# Altium schematic sheet Drive_Motor_Section.SchDoc
size A4; Organization: Altium Limited; Address1: L3, 12a Rodborough Rd; Address2: Frenchs Forest; Address3: NSW; Address4: Australia 2086; DocumentNumber: 3; SheetNumber: 3; SheetTotal: 8
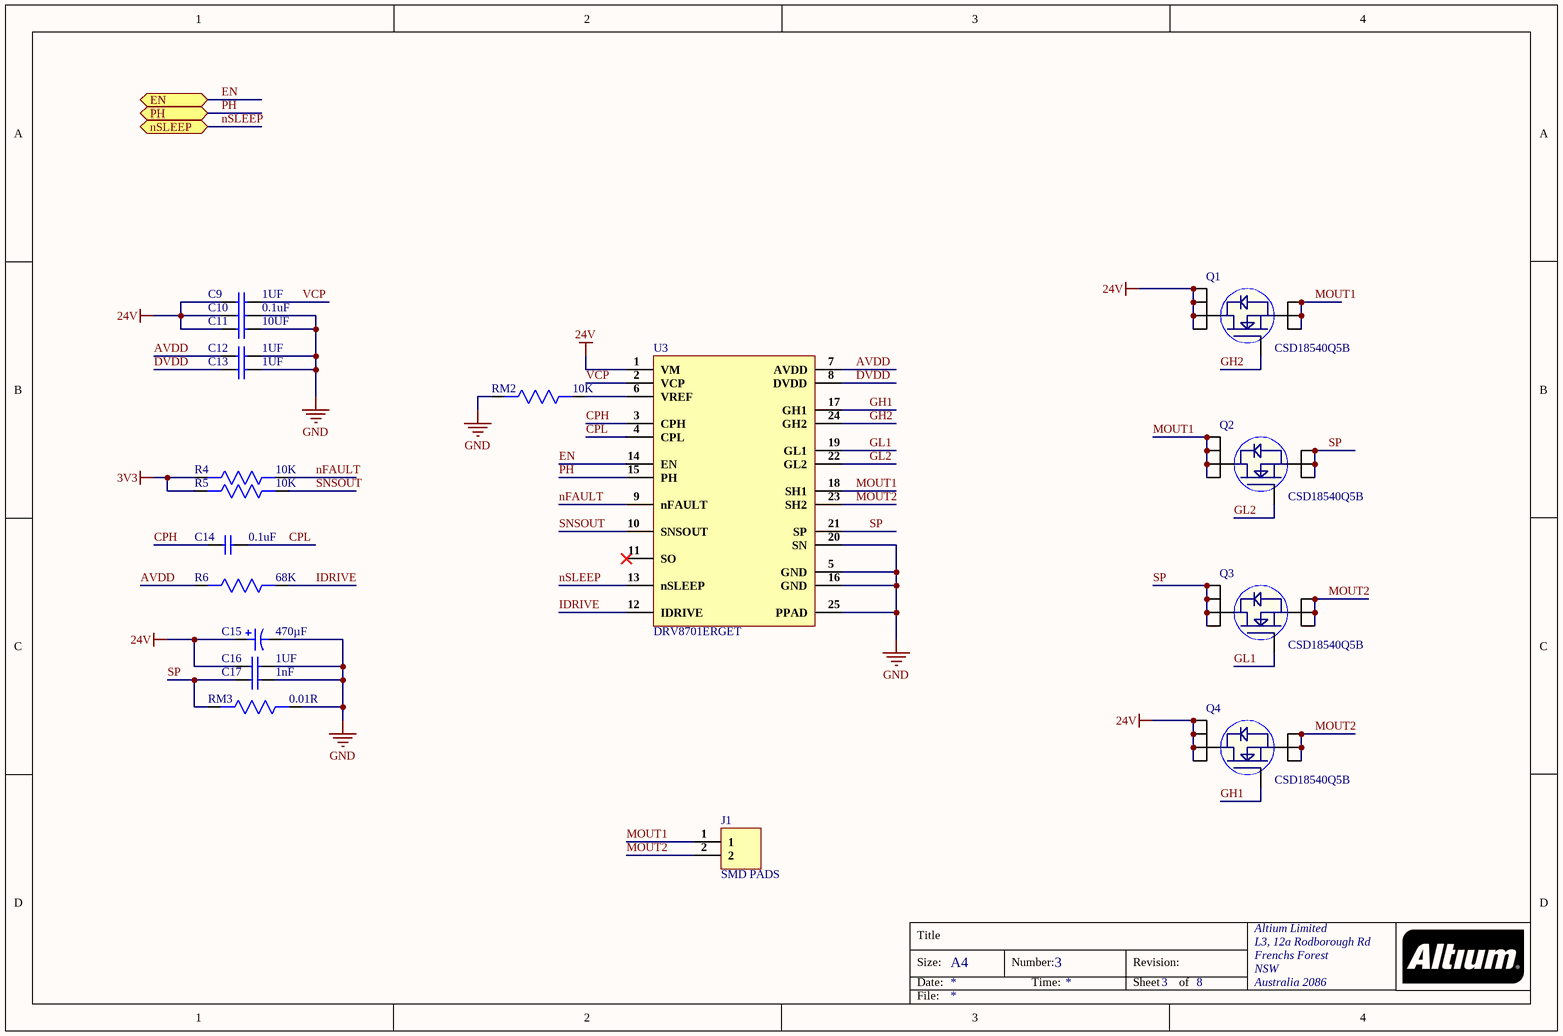
[diagram p0: Drive_Motor_Section.SchDoc]

## Parts
C9  1UF  [Cap0805]
C10  0.1uF  [CAP 0402]
C11  10UF  [Cap1206]
C12  1UF  [Cap0805]
C13  1UF  [Cap0805]
C14  0.1uF  [CAP 0402]
C15  470µF  [UCD1V471MNL6GS]
C16  1UF  [Cap0805]
C17  1nF  [CAP 0201]
J1  SMD PADS  [SMD PAD]
Q1  CSD18540Q5B  [8-VSON-CLIP]
Q2  CSD18540Q5B  [8-VSON-CLIP]
Q3  CSD18540Q5B  [8-VSON-CLIP]
Q4  CSD18540Q5B  [8-VSON-CLIP]
R4  10K  [Res-0201]
R5  10K  [Res-0201]
R6  68K  [Res0603]
RM2  10K  [Res-0201]
RM3  0.01R  [Res0603]
U3  DRV8701ERGET  [DRV8701ERGET]

## Ports
EN (bidir), nSLEEP (bidir), PH (bidir)

## Nets
3V3: R4.2 R5.2
24V: C9.1 C10.1 C11.1 C15.1 C16.1 Q1.5(D) Q1.6(D) Q1.7(D) Q1.8(D) Q4.5(D) Q4.6(D) Q4.7(D) Q4.8(D) U3.1(VM)
GND: C10.2 C11.2 C12.2 C13.2 C15.2 C16.2 C17.2 RM2.2 RM3.1 U3.5(GND) U3.16(GND) U3.20(SN) U3.25(PPAD)
AVDD: C12.1 R6.2 U3.7(AVDD)
CPH: C14.1 U3.3(CPH)
CPL: C14.2 U3.4(CPL)
DVDD: C13.1 U3.8(DVDD)
EN: U3.14(EN) ; port EN
GH1: Q4.4(G) U3.17(GH1)
GH2: Q1.4(G) U3.24(GH2)
GL1: Q3.4(G) U3.19(GL1)
GL2: Q2.4(G) U3.22(GL2)
IDRIVE: R6.1 U3.12(IDRIVE)
MOUT1: J1.1 Q1.1(S) Q1.2(S) Q1.3(S) Q2.5(D) Q2.6(D) Q2.7(D) Q2.8(D) U3.18(SH1)
MOUT2: J1.2 Q3.1(S) Q3.2(S) Q3.3(S) Q4.1(S) Q4.2(S) Q4.3(S) U3.23(SH2)
nFAULT: R4.1 U3.9(nFAULT)
nSLEEP: U3.13(nSLEEP) ; port nSLEEP
PH: U3.15(PH) ; port PH
SNSOUT: R5.1 U3.10(SNSOUT)
SP: C17.1 Q2.1(S) Q2.2(S) Q2.3(S) Q3.5(D) Q3.6(D) Q3.7(D) Q3.8(D) RM3.2 U3.21(SP)
VCP: C9.2 U3.2(VCP)
NetRM2_1: RM2.1 U3.6(VREF)

Not connected (* = marked no-connect by the designer): U3 11(SO)*

## Notes on the sheet
- Title
- Size:
- Date:
- A4
- Number:
- Time:
- Revision:
- Sheet
- of
- File:

## Library data of the parts
C9 C12 C13 C16 = CL21B105KBFNNNE: CAP CER 1UF 50V X7R 0805; Manufacturer: Samsung; Tolerance: 10%; Supplier 1: Digi-Key; Manufacturer Part Number: CL21B105KBFNNNE; Stock 1: 550461; Pricing 1: 1=0.13, 10=0.093, 50=0.053, 100=0.0439, 500=0.03076, 1000=0.02547 (USD); Mount: Surface Mount; Case/Package: 0805; Case Code (Metric): 2012; Case Code (Imperial): 0805; Min Operating Temperature: -55°C; Max Operating Temperature: 125°C; Packaging: Tape and Reel; Package Quantity: 1; Capacitance: 1uF; Voltage Rating: 50V; Dielectric: X7R; Voltage: 50V; Length: 2mm; Height: 1.25mm; Width: 0.049inch; Thickness: 0.053inch; Depth: 1.25mm; Radiation Hardening: No; ComponentLink1URL: http://www.samsungsem.com/kr/support/product-search/mlcc/CL21B105KBFNNNE.jsp?src-supplier=Digi-Key; ComponentLink1Description: http://www.samsungsem.com/kr/support/product-search/mlcc/CL21B105KBFNNNE.jsp?src-supplier=Digi-Key; ComponentLink2URL: http://www1.futureelectronics.com/doc/SAMSUNG/CL21B105KBFNNNE.pdf?src-supplier=Future+Electronics; ComponentLink2Description: http://www1.futureelectronics.com/doc/SAMSUNG/CL21B105KBFNNNE.pdf?src-supplier=Future+Electronics; ComponentLink3URL: https://www.verical.com/server-webapp/html/getDatasheet?partID=354075&src-supplier=Verical; ComponentLink3Description: https://www.verical.com/server-webapp/html/getDatasheet?partID=354075&src-supplier=Verical; Supplier Part Number 1: 1276-1029-1-ND
C10 C14 = CC0402KRX7R7BB104: CAP CER 0.1UF 16V X7R 0402; Manufacturer: Yageo; Tolerance: 10%; Capacitance: 100nF; Supplier 1: Digi-Key; Manufacturer Part Number: CC0402KRX7R7BB104; Stock 1: 9987374; Pricing 1: 1=0.1, 10=0.034, 100=0.015, 500=0.0107, 1000=0.00841, 2500=0.00764, 5000=0.00703 (USD); Mount: Surface Mount; Case/Package: 0402; Number of Pins: 2; Case Code (Metric): 1005; Case Code (Imperial): 0402; Min Operating Temperature: -55°C; Max Operating Temperature: 125°C; Dielectric: X7R; Voltage Rating: 16V; Voltage Rating (DC): 16V; Packaging: Tape and Reel; Package Quantity: 1; Termination: SMD/SMT; Composition: Ceramic; Voltage: 16V; Length: 1mm; Height: 0.5mm; Width: 0.02inch; Thickness: 0.022inch; Depth: 0.5mm; Radiation Hardening: No; REACH SVHC: No SVHC; Lead Free: Lead Free; Halogen Free: Halogen Free; ComponentLink1URL: http://www.yageo.com/documents/recent/UPY-GPHC_X7R_6.3V-to-50V_8.pdf?src-supplier=Avnet+Europe; ComponentLink1Description: http://www.yageo.com/documents/recent/UPY-GPHC_X7R_6.3V-to-50V_8.pdf?src-supplier=Avnet+Europe; ComponentLink2URL: http://www.yageo.com/documents/recent/UPY-GPHC_X7R_6.3V-to-50V_18.pdf?src-supplier=Digi-Key; ComponentLink2Description: http://www.yageo.com/documents/recent/UPY-GPHC_X7R_6.3V-to-50V_18.pdf?src-supplier=Digi-Key; ComponentLink3URL: http://www.yageo.com/documents/recent/UPY-GPHC_X7R_6.3V-to-50V_8.pdf?src-supplier=Avnet; ComponentLink3Description: http://www.yageo.com/documents/recent/UPY-GPHC_X7R_6.3V-to-50V_8.pdf?src-supplier=Avnet; ComponentLink4URL: http://www.yageo.com/documents/recent/UPY-GPHC_X7R_6.3V-to-50V_18.pdf?src-supplier=Mouser; ComponentLink4Description: http://www.yageo.com/documents/recent/UPY-GPHC_X7R_6.3V-to-50V_18.pdf?src-supplier=Mouser; ComponentLink5URL: http://www.farnell.com/datasheets/2167236.pdf?src-supplier=Element14; ComponentLink5Description: http://www.farnell.com/datasheets/2167236.pdf?src-supplier=Element14; ComponentLink6URL: http://www.farnell.com/datasheets/1489800.pdf?src-supplier=Element14; ComponentLink6Description: http://www.farnell.com/datasheets/1489800.pdf?src-supplier=Element14; Supplier Part Number 1: 311-1338-1-ND
C11 = CL31B106KBHNNNE: CAP CER 10UF 50V X7R 1206; Manufacturer: Samsung; Tolerance: 10%; Supplier 1: Digi-Key; Manufacturer Part Number: CL31B106KBHNNNE; Stock 1: 177239; Pricing 1: 1=0.39, 10=0.268, 50=0.1872, 100=0.1605, 500=0.12038, 1000=0.10166 (USD); Mount: Surface Mount; Case/Package: 1206; Case Code (Metric): 3216; Case Code (Imperial): 1206; Min Operating Temperature: -55°C; Max Operating Temperature: 125°C; Capacitance: 10uF; Dielectric: X7R; Voltage Rating (DC): 50V; Packaging: Tape and Reel; Voltage Rating: 50V; Length: 0.126inch; Width: 0.063inch; Thickness: 0.071inch; Lead Free: Lead Free; ComponentLink1URL: http://www.samsungsem.com/kr/support/product-search/mlcc/CL31B106KBHNNNE.jsp?src-supplier=Digi-Key; ComponentLink1Description: http://www.samsungsem.com/kr/support/product-search/mlcc/CL31B106KBHNNNE.jsp?src-supplier=Digi-Key; Supplier Part Number 1: 1276-6767-1-ND
C15 = UCD1V471MNL6GS: 470µF 35V Aluminum Electrolytic Capacitors Radial, Can - SMD; Manufacturer: Nichicon; Capacitance: 470uF; Tolerance: 20%; Ripple Current: 950mA; Leakage Current: 3uA; Supplier 1: Digi-Key; Manufacturer Part Number: UCD1V471MNL6GS; Stock 1: 2530; Pricing 1: 1=1.04, 10=0.789, 50=0.6556, 100=0.5646 (USD); Case/Package: Aluminum; Min Operating Temperature: -55°C; Max Operating Temperature: 105°C; Voltage Rating (DC): 35V; Packaging: Tape and Reel; Package Quantity: 400; Termination: SMD/SMT; Length: 13.5mm; ComponentLink1URL: http://www.mouser.com/ds/2/293/e-ucd-883803.pdf?src-supplier=Mouser; ComponentLink1Description: http://www.mouser.com/ds/2/293/e-ucd-883803.pdf?src-supplier=Mouser; ComponentLink2URL: http://nichicon-us.com/english/products/pdfs/e-ucd.pdf?src-supplier=Digi-Key; ComponentLink2Description: http://nichicon-us.com/english/products/pdfs/e-ucd.pdf?src-supplier=Digi-Key; Supplier Part Number 1: 493-14715-6-ND
C17 = 0201B102K160CT: CAP CER 1000PF 16V X7R 0201; Manufacturer: Walsin Technologies; Tolerance: 10%; Supplier 1: Digi-Key; Manufacturer Part Number: 0201B102K160CT; Stock 1: 360567; Pricing 1: 1=0.1, 10=0.015, 50=0.0084, 100=0.0068, 500=0.00488, 1000=0.00384, 2500=0.00349, 5000=0.00321 (USD); Case/Package: 0201; Case Code (Metric): 0603; Case Code (Imperial): 0201; Min Operating Temperature: -55°C; Max Operating Temperature: 125°C; Capacitance: 1nF; Dielectric: X7R; Packaging: Cut Tape; Voltage Rating (DC): 16V; Voltage Rating: 16V; REACH SVHC: Unknown; Supplier Part Number 1: 1292-1117-6-ND
J1 = SMD PAD
Q1-Q4 = CSD18540Q5B: MOSFET N-CH 60V 100A 8VSON; Manufacturer: Texas Instruments; Rds On Max: 2.2mR; Input Capacitance: 4.23nF; Max Power Dissipation: 3.1W; Fall Time: 3ns; Turn-Off Delay Time: 20ns; Rise Time: 9ns; Turn-On Delay Time: 6ns; Gate to Source Voltage (Vgs): 20V; Element Configuration: Single; Supplier 1: Digi-Key; Manufacturer Part Number: CSD18540Q5B; Stock 1: 0; Pricing 1: 1=2.44, 10=2.189, 25=2.0652, 100=1.6107, 250=1.5694, 500=1.3629, 1000=1.1564 (USD); Mount: Surface Mount; Number of Pins: 8; Contact Plating: Gold; Min Operating Temperature: -55°C; Max Operating Temperature: 150°C; Packaging: Tape and Reel; Drain to Source Voltage (Vdss): 60V; Continuous Drain Current (ID): 100A; Lead Free: Contains Lead; ComponentLink1URL: http://www.ti.com/lit/gpn/csd18540q5b?src-supplier=Mouser; ComponentLink1Description: http://www.ti.com/lit/gpn/csd18540q5b?src-supplier=Mouser; ComponentLink2URL: http://www.ti.com/general/docs/lit/getliterature.tsp?genericPartNumber=CSD18540Q5B&amp;&amp;fileType=pdf&src-supplier=Avnet+Asia; ComponentLink2Description: http://www.ti.com/general/docs/lit/getliterature.tsp?genericPartNumber=CSD18540Q5B&amp;&amp;fileType=pdf&src-supplier=Avnet+Asia; ComponentLink3URL: http://www.ti.com/general/docs/lit/getliterature.tsp?genericPartNumber=CSD18540Q5B&&fileType=pdf&src-supplier=Avnet; ComponentLink3Description: http://www.ti.com/general/docs/lit/getliterature.tsp?genericPartNumber=CSD18540Q5B&&fileType=pdf&src-supplier=Avnet; ComponentLink4URL: http://www.ti.com/lit/ds/symlink/csd18540q5b.pdf?src-supplier=Digi-Key; ComponentLink4Description: http://www.ti.com/lit/ds/symlink/csd18540q5b.pdf?src-supplier=Digi-Key; Supplier Part Number 1: 296-41076-1-ND
R4 R5 RM2 = RC0201JR-0710KL: RES SMD 10K OHM 5% 1/20W 0201; Manufacturer: Yageo; Resistance: 10kR; Temperature Coefficient: 200ppm/°C; Power Rating: 50mW; Voltage Rating: 25V; Supplier 1: Digi-Key; Manufacturer Part Number: RC0201JR-0710KL; Stock 1: 1378070; Pricing 1: 1=0.1, 10=0.028, 100=0.0115, 1000=0.00517, 2500=0.00448, 5000=0.00371 (USD); Case/Package: 0201; Contact Plating: Tin,Matte; Case Code (Imperial): 0201; Case Code (Metric): 0603; Min Operating Temperature: -55°C; Max Operating Temperature: 125°C; Tolerance: 5%; Composition: Thick Film; Packaging: Tape and Reel; Termination: SMD/SMT; Military Standard: Not; Voltage Rating (DC): 25V; Length: 0.6mm; Depth: 0.3mm; Radiation Hardening: No; REACH SVHC: Unknown; Lead Free: Lead Free; ComponentLink1URL: http://www.farnell.com/datasheets/2167052.pdf?src-supplier=Element14; ComponentLink1Description: http://www.farnell.com/datasheets/2167052.pdf?src-supplier=Element14; ComponentLink2URL: http://www.yageo.com/documents/recent/PYu-RC0201_51_RoHS_L_8.pdf?src-supplier=Avnet+Europe; ComponentLink2Description: http://www.yageo.com/documents/recent/PYu-RC0201_51_RoHS_L_8.pdf?src-supplier=Avnet+Europe; ComponentLink3URL: http://www.yageo.com/documents/recent/PYu-RC0201_51_RoHS_L_8.pdf?src-supplier=Avnet; ComponentLink3Description: http://www.yageo.com/documents/recent/PYu-RC0201_51_RoHS_L_8.pdf?src-supplier=Avnet; Supplier Part Number 1: 311-10KNDKR-ND
R6 RM3 = RC0603FR-0768KL: RES SMD 68K OHM 1% 1/10W 0603; Manufacturer: Yageo; Power Rating: 100mW; Resistance: 68kR; Voltage Rating: 50V; Temperature Coefficient: 100ppm/°C; Supplier 1: Digi-Key; Manufacturer Part Number: RC0603FR-0768KL; Stock 1: 2780416; Pricing 1: 1=0.1, 10=0.023, 100=0.0094, 1000=0.00421, 2500=0.00366 (USD); Case/Package: 0603; Number of Pins: 2; Case Code (Metric): 1608; Case Code (Imperial): 0603; Min Operating Temperature: -55°C; Max Operating Temperature: 155°C; Package Quantity: 1; Tolerance: 1%; Packaging: Tape and Reel; Voltage Rating (DC): 50V; Composition: Thick Film; Number of Terminations: 2; Termination: SMD/SMT; Max Power Dissipation: 100mW; Features: Moisture Resistant; Length: 0.063inch; Height: 0.022inch; Width: 0.031inch; Depth: 0.8mm; REACH SVHC: Unknown; Lead Free: Lead Free; ComponentLink1URL: http://www.yageo.com/documents/recent/PYu-RC_Group_51_RoHS_L_10.pdf?src-supplier=Digi-Key; ComponentLink1Description: http://www.yageo.com/documents/recent/PYu-RC_Group_51_RoHS_L_10.pdf?src-supplier=Digi-Key; ComponentLink2URL: http://documents.rs-components.com/techlib://itc_doclist_GB.htm?stockno=5048243&src-supplier=RSComponents; ComponentLink2Description: http://documents.rs-components.com/techlib://itc_doclist_GB.htm?stockno=5048243&src-supplier=RSComponents; ComponentLink3URL: http://www.yageo.com/documents/recent/PYu-RC_Group_51_RoHS_L_9.pdf?src-supplier=Digi-Key; ComponentLink3Description: http://www.yageo.com/documents/recent/PYu-RC_Group_51_RoHS_L_9.pdf?src-supplier=Digi-Key; ComponentLink4URL: http://www.farnell.com/datasheets/1868787.pdf?src-supplier=Element14; ComponentLink4Description: http://www.farnell.com/datasheets/1868787.pdf?src-supplier=Element14; ComponentLink5URL: http://www.farnell.com/datasheets/443971.pdf?src-supplier=Element14; ComponentLink5Description: http://www.farnell.com/datasheets/443971.pdf?src-supplier=Element14; ComponentLink6URL: http://www.farnell.com/datasheets/2167052.pdf?src-supplier=Element14; ComponentLink6Description: http://www.farnell.com/datasheets/2167052.pdf?src-supplier=Element14; Supplier Part Number 1: 311-68.0KHRDKR-ND
U3 = DRV8701ERGET: Motor Driver Power MOSFET Parallel 24-VQFN (4x4); Manufacturer: Texas Instruments; Supplier 1: Digi-Key; Manufacturer Part Number: DRV8701ERGET; Stock 1: 10031; Pricing 1: 1=2.37, 10=2.133, 25=2.0124, 100=1.61 (USD); Mount: Surface Mount; Case/Package: VQFN; Min Operating Temperature: -40°C; Max Operating Temperature: 125°C; Packaging: Tape and Reel; Interface: Parallel; Lead Free: Lead Free; ComponentLink1URL: http://www.ti.com/general/docs/lit/getliterature.tsp?genericPartNumber=DRV8701&&fileType=pdf&src-supplier=Avnet; ComponentLink1Description: http://www.ti.com/general/docs/lit/getliterature.tsp?genericPartNumber=DRV8701&&fileType=pdf&src-supplier=Avnet; ComponentLink2URL: http://www.ti.com/lit/ds/symlink/drv8701.pdf?src-supplier=Digi-Key; ComponentLink2Description: http://www.ti.com/lit/ds/symlink/drv8701.pdf?src-supplier=Digi-Key; Supplier Part Number 1: 296-42155-1-ND